# Altium schematic sheet eGPU_Riser.SchDoc
size A3; SheetNumber: 2; SheetTotal: 2
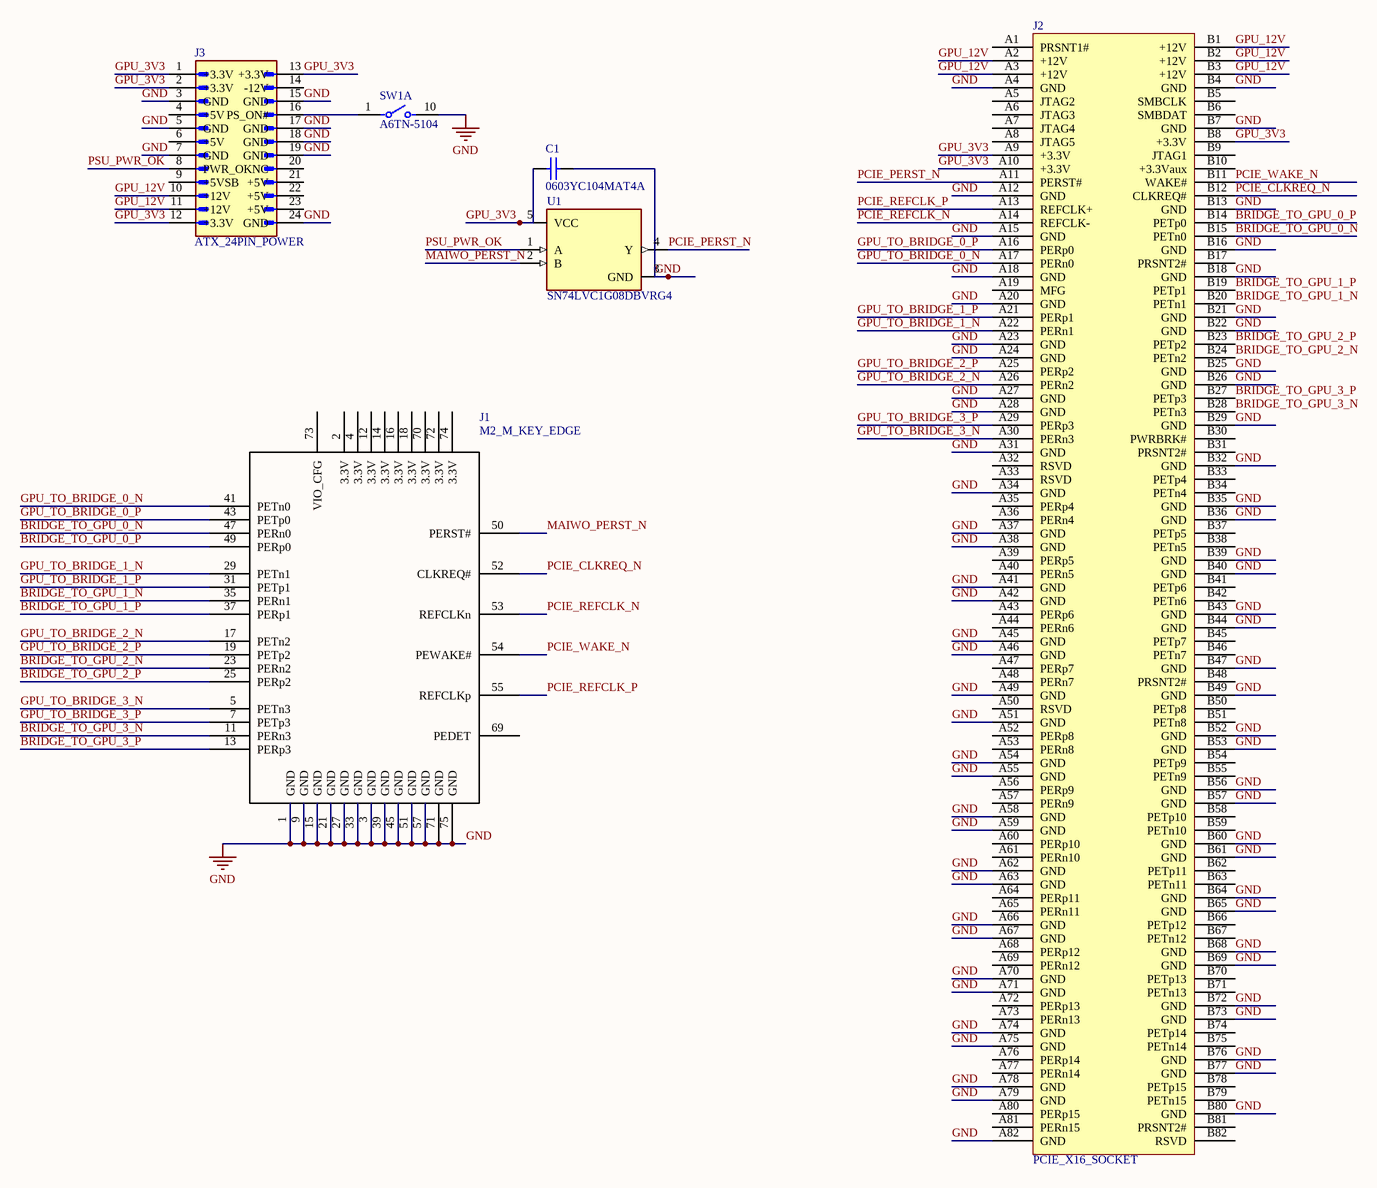
[diagram p0: eGPU_Riser.SchDoc]

## Parts
C1  0603YC104MAT4A  [CAPC1608X90X35LL15T15]
J1  M2_M_KEY_EDGE
J2  PCIE_X16_SOCKET  [AMPHENOL_10146065-113Y0LF]
J3  ATX_24PIN_POWER  [MOLEX_39281243]
SW1  A6TN-5104  [FP-A6TN-5104-MFG]  (part A of 5)
U1  SN74LVC1G08DBVRG4  [FP-DBV0005A-IPC_A]

## Nets
GND: C1.2 J1.1(GND) J1.3(GND) J1.9(GND) J1.15(GND) J1.21(GND) J1.27(GND) J1.33(GND) J1.39(GND) J1.45(GND) J1.51(GND) J1.57(GND) J1.71(GND) J1.75(GND) J2.A4(GND) J2.A12(GND) J2.A15(GND) J2.A18(GND) J2.A20(GND) J2.A23(GND) J2.A24(GND) J2.A27(GND) J2.A28(GND) J2.A31(GND) J2.A34(GND) J2.A37(GND) J2.A38(GND) J2.A41(GND) J2.A42(GND) J2.A45(GND) J2.A46(GND) J2.A49(GND) J2.A51(GND) J2.A54(GND) J2.A55(GND) J2.A58(GND) J2.A59(GND) J2.A62(GND) J2.A63(GND) J2.A66(GND) J2.A67(GND) J2.A70(GND) J2.A71(GND) J2.A74(GND) J2.A75(GND) J2.A78(GND) J2.A79(GND) J2.A82(GND) J2.B4(GND) J2.B7(GND) J2.B13(GND) J2.B16(GND) J2.B18(GND) J2.B21(GND) J2.B22(GND) J2.B25(GND) J2.B26(GND) J2.B29(GND) J2.B32(GND) J2.B35(GND) J2.B36(GND) J2.B39(GND) J2.B40(GND) J2.B43(GND) J2.B44(GND) J2.B47(GND) J2.B49(GND) J2.B52(GND) J2.B53(GND) J2.B56(GND) J2.B57(GND) J2.B60(GND) J2.B61(GND) J2.B64(GND) J2.B65(GND) J2.B68(GND) J2.B69(GND) J2.B72(GND) J2.B73(GND) J2.B76(GND) J2.B77(GND) J2.B80(GND) J3.3(GND) J3.5(GND) J3.7(GND) J3.15(GND) J3.17(GND) J3.18(GND) J3.19(GND) J3.24(GND) SW1.10 U1.3(GND)
BRIDGE_TO_GPU_0_N: J1.47(PERn0) J2.B15(PETn0)
BRIDGE_TO_GPU_0_P: J1.49(PERp0) J2.B14(PETp0)
BRIDGE_TO_GPU_1_N: J1.35(PERn1) J2.B20(PETn1)
BRIDGE_TO_GPU_1_P: J1.37(PERp1) J2.B19(PETp1)
BRIDGE_TO_GPU_2_N: J1.23(PERn2) J2.B24(PETn2)
BRIDGE_TO_GPU_2_P: J1.25(PERp2) J2.B23(PETp2)
BRIDGE_TO_GPU_3_N: J1.11(PERn3) J2.B28(PETn3)
BRIDGE_TO_GPU_3_P: J1.13(PERp3) J2.B27(PETp3)
GPU_3V3: C1.1 J2.A9(+3.3V) J2.A10(+3.3V) J2.B8(+3.3V) J3.1(+3.3V) J3.2(+3.3V) J3.12(+3.3V) J3.13(+3.3V) U1.5(VCC)
GPU_12V: J2.A2(+12V) J2.A3(+12V) J2.B1(+12V) J2.B2(+12V) J2.B3(+12V) J3.10(+12V) J3.11(+12V)
GPU_TO_BRIDGE_0_N: J1.41(PETn0) J2.A17(PERn0)
GPU_TO_BRIDGE_0_P: J1.43(PETp0) J2.A16(PERp0)
GPU_TO_BRIDGE_1_N: J1.29(PETn1) J2.A22(PERn1)
GPU_TO_BRIDGE_1_P: J1.31(PETp1) J2.A21(PERp1)
GPU_TO_BRIDGE_2_N: J1.17(PETn2) J2.A26(PERn2)
GPU_TO_BRIDGE_2_P: J1.19(PETp2) J2.A25(PERp2)
GPU_TO_BRIDGE_3_N: J1.5(PETn3) J2.A30(PERn3)
GPU_TO_BRIDGE_3_P: J1.7(PETp3) J2.A29(PERp3)
MAIWO_PERST_N: J1.50(PERST#) U1.2(B)
PCIE_CLKREQ_N: J1.52(CLKREQ#) J2.B12(CLKREQ#)
PCIE_PERST_N: J2.A11(PERST#) U1.4(Y)
PCIE_REFCLK_N: J1.53(REFCLKn) J2.A14(REFCLK-)
PCIE_REFCLK_P: J1.55(REFCLKp) J2.A13(REFCLK+)
PCIE_WAKE_N: J1.54(PEWAKE#) J2.B11(WAKE#)
PSU_PWR_OK: J3.8(PWR_OK) U1.1(A)
NetJ3_16: J3.16(PS_ON#) SW1.1

Not connected (* = marked no-connect by the designer): J1 2(3.3V) 4(3.3V) 12(3.3V) 14(3.3V) 16(3.3V) 18(3.3V) 69(PEDET) 70(3.3V) 72(3.3V) 73(VIO_CFG) 74(3.3V); J2 A1(PRSNT1#) A5(JTAG2) A6(JTAG3) A7(JTAG4) A8(JTAG5) A19(MFG) A32(RSVD) A33(RSVD) A35(PERp4) A36(PERn4) A39(PERp5) A40(PERn5) A43(PERp6) A44(PERn6) A47(PERp7) A48(PERn7) A50(RSVD) A52(PERp8) A53(PERn8) A56(PERp9) A57(PERn9) A60(PERp10) A61(PERn10) A64(PERp11) A65(PERn11) A68(PERp12) A69(PERn12) A72(PERp13) A73(PERn13) A76(PERp14) A77(PERn14) A80(PERp15) A81(PERn15) B5(SMBCLK) B6(SMBDAT) B9(JTAG1) B10(+3.3Vaux) B17(PRSNT2#) B30(PWRBRK#) B31(PRSNT2#) B33(PETp4) B34(PETn4) B37(PETp5) B38(PETn5) B41(PETp6) B42(PETn6) B45(PETp7) B46(PETn7) B48(PRSNT2#) B50(PETp8) B51(PETn8) B54(PETp9) B55(PETn9) B58(PETp10) B59(PETn10) B62(PETp11) B63(PETn11) B66(PETp12) B67(PETn12) B70(PETp13) B71(PETn13) B74(PETp14) B75(PETn14) B78(PETp15) B79(PETn15) B81(PRSNT2#) B82(RSVD); J3 4(+5V) 6(+5V) 9(+5VSB) 14(-12V) 20(NC) 21(+5V) 22(+5V) 23(+5V)

## Library data of the parts
C1 = CMP-2006-02126-1: Manufacturer: AVX Interconnect / Elco; Part Number: 0603YC104MAT4A
J3 = CMP-002-00000-1: Conn Wire to Board HDR 24Power POS 4.2mm Solder ST Top Entry Thru-Hole Mini-Fit Jrâ„¢ Bag; MF: Molex; Component Type: Standard; Design Item ID: 39281243; Pins: 24; Source: 39281243.SchLib; SnapEDA_Link: https://www.snapeda.com/parts/39281243/Molex/view-part/?ref=snap; MP: 39281243; Case/Package: None; Check_prices: https://www.snapeda.com/parts/39281243/Molex/view-part/?ref=eda; Value: *
SW1 = CMP-08827-000038-1: SWITCH SLIDE DIP SPST 25MA 24V; Actuator Length: 1mm; Pitch: 0.1inch; Actuator Type: Slide (Standard); Contact Resistance: 200mR; Number of Circuits: 5; Washable: Yes; Electrical Life: 1000Cycles; Length: 0.576inch; Voltage Rating (DC): 24V; Max Voltage Rating (DC): 24V; Orientation: Straight; Terminal Pitch: 2.54mm; Packaging: Rail/Tube; RoHS Compliant: Yes; Termination: PC Pins; Series: A6TN; Radiation Hardening: No; Max Operating Temperature: 85°C; Mount: Through Hole; Throw Configuration: SPST; Package Quantity: 30; Current Rating: 25mA; Min Operating Temperature: -30°C; Number of Positions: 5
U1 = CMP-04903-000072-1: IC GATE AND 1CH 2-INP SOT23-5; Low Level Output Current: 32mA; Number of Gates: 1; Quiescent Current: 10uA; Propagation Delay: 4ns; Logic Function: AND GATE; Number of Inputs: 2; Max Supply Voltage: 5.5V; High Level Output Current: -32mA; Min Supply Voltage: 1.65V; Series: 74LVC; Output Current: 32mA; Weight: 0.000557oz; RoHS Compliant: Yes; Number of Bits: 1; Lead Free: Lead Free; Number of Input Lines: 2; Technology: CMOS; Case/Package: SOT-23-5; Mount: Surface Mount; REACH SVHC: No SVHC; Max Operating Temperature: 125°C; Number of Output Lines: 1; Number of Outputs: 1; Min Operating Temperature: -40°C; Number of Pins: 5; Radiation Hardening: No; Number of Elements: 1; Packaging: Tape and Reel; Number of Circuits: 1; Package Quantity: 3000